# Altium schematic sheet power_management.SchDoc: Low-noise powr supply for digital systems
size A4; DocumentNumber: ADC-SCH-19; SheetNumber: 19; SheetTotal: 20
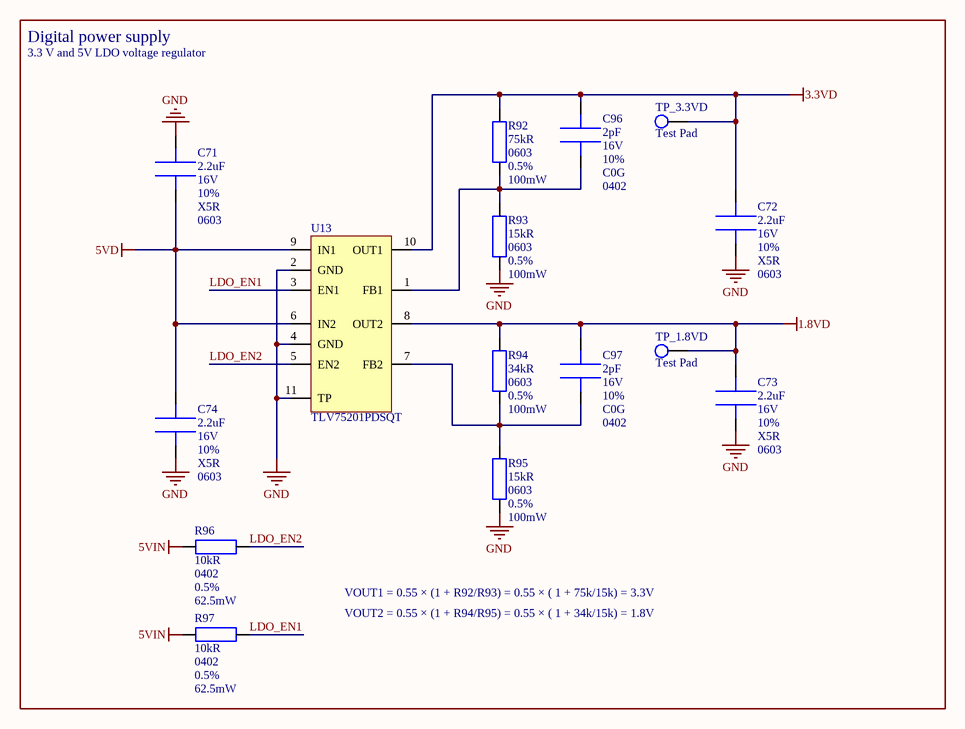
[diagram p0: power_management.SchDoc]

## Parts
C71  value 2.2uF  Voltage: 16V  Tolerance: 10%  Dielectric: X5R  Package: 0603  [CAPC_0603]  (hidden comment: C0603C225K4PAC)
C72  value 2.2uF  Voltage: 16V  Tolerance: 10%  Dielectric: X5R  Package: 0603  [CAPC_0603]  (hidden comment: C0603C225K4PAC)
C73  value 2.2uF  Voltage: 16V  Tolerance: 10%  Dielectric: X5R  Package: 0603  [CAPC_0603]  (hidden comment: C0603C225K4PAC)
C74  value 2.2uF  Voltage: 16V  Tolerance: 10%  Dielectric: X5R  Package: 0603  [CAPC_0603]  (hidden comment: C0603C225K4PAC)
C96  value 2pF  Voltage: 16V  Tolerance: 10%  Dielectric: C0G  Package: 0402  [CAPC_0402]  (hidden comment: GJM1555C1H2R0CB01J)
C97  value 2pF  Voltage: 16V  Tolerance: 10%  Dielectric: C0G  Package: 0402  [CAPC_0402]  (hidden comment: GJM1555C1H2R0CB01J)
R92  value 75kR  Package: 0603  Tolerance: 0.5%  Power: 100mW  [RESC_0603]  (hidden comment: RT0603DRD0775KL)
R93  value 15kR  Package: 0603  Tolerance: 0.5%  Power: 100mW  [RESC_0603]  (hidden comment: RT0603DRD0715KL)
R94  value 34kR  Package: 0603  Tolerance: 0.5%  Power: 100mW  [RESC_0603]  (hidden comment: RT0603DRE0734KL)
R95  value 15kR  Package: 0603  Tolerance: 0.5%  Power: 100mW  [RESC_0603]  (hidden comment: RT0603DRD0715KL)
R96  value 10kR  Package: 0402  Tolerance: 0.5%  Power: 62.5mW  [RESC_0402]  (hidden comment: AC0402DR-0710KL)
R97  value 10kR  Package: 0402  Tolerance: 0.5%  Power: 62.5mW  [RESC_0402]  (hidden comment: AC0402DR-0710KL)
TP_1.8VD  Test Pad  [TP_1.4mm]
TP_3.3VD  Test Pad  [TP_1.4mm]
U13  TLV75201PDSQT  [IC_WSON-10]

## Nets
1.8VD: C73.1 C97.1 R94.1 TP_1.8VD.1 U13.8(OUT2)
3.3VD: C72.1 C96.1 R92.2 TP_3.3VD.1 U13.10(OUT1)
5VD: C71.2 C74.1 U13.6(IN2) U13.9(IN1)
5VIN: R96.2 R97.2
GND: C71.1 C72.2 C73.2 C74.2 R93.1 R95.1 U13.2(GND) U13.4(GND) U13.11(TP)
LDO_EN1: R97.1 U13.3(EN1)
LDO_EN2: R96.1 U13.5(EN2)
NetC96_2: C96.2 R92.1 R93.2 U13.1(FB1)
NetC97_2: C97.2 R94.2 R95.2 U13.7(FB2)

## Notes on the sheet
- Digital power supply
- 3.3 V and 5V LDO voltage regulator
- VOUT1 = 0.55 × (1 + R92/R93) = 0.55 × ( 1 + 75k/15k) = 3.3V
- VOUT2 = 0.55 × (1 + R94/R95) = 0.55 × ( 1 + 34k/15k) = 1.8V
- Drawn by
- Approved by
- Document type
- Date of issue
- Legal owner
- Title
- Circuit diagram
- File
- AGH Marines
- Document no.
- Revision
- Status
- Sheet
- Size
- Lang.
- /
- A4
- EN

## Library data of the parts
C71-C74 = C0603C225K4PAC: Multilayer Ceramic Capacitors MLCC - SMD/SMT 16V 2.2uF X5R 0603 10%; Manufacturer: KEMET; Supplier 1: Mouser; Supplier Part Number 1: 80-C0603C225K4PAC
C96 C97 = GJM1555C1H2R0CB01J: Multilayer Ceramic Capacitors MLCC - SMD/SMT 2 pF 50 VDC 0.25 pF 0402 C0G (NP0); Manufacturer: Murata Electronics; Supplier 1: Mouser; Supplier Part Number 1: 81-GJM1555C1H2R0CB1J
R92 = RT0603DRD0775KL: Thin Film Resistors 1/10W 75K ohm .5% 25ppm; Manufacturer: YAGEO; Supplier 1: Mouser; Supplier Part Number 1: 603-RT0603DRD0775KL
R93 R95 = RT0603DRD0715KL: Thin Film Resistors 15K Ohm 0.5% 1/10W 75 Volts 25ppm; Manufacturer: YAGEO; Supplier 1: Mouser; Supplier Part Number 1: 603-RT0603DRD0715KL
R94 = RT0603DRE0734KL: Thin Film Resistors 1/10W 34K ohm .5% 50ppm; Manufacturer: YAGEO; Supplier 1: Mouser; Supplier Part Number 1: 603-RT0603DRE0734KL
R96 R97 = AC0402DR-0710KL: Thick Film Resistors - SMD 10 kOhms 1/16 W 50 V 1% 0402 100 PPM / C - 55 C + 155 C AEC-Q200; Manufacturer: YAGEO; Supplier 1: Mouser; Supplier Part Number 1: 603-AC0402DR-0710KL
U13 = TLV75201PDSQT: LDO Voltage Regulators 1-A low-IQ high-PS RR adjustable dual A 595-TLV75201PDSQR; Manufacturer: Texas Instruments; Package: WSON-10; Supplier 1: Mouser; Supplier Part Number 1: 595-TLV75201PDSQT